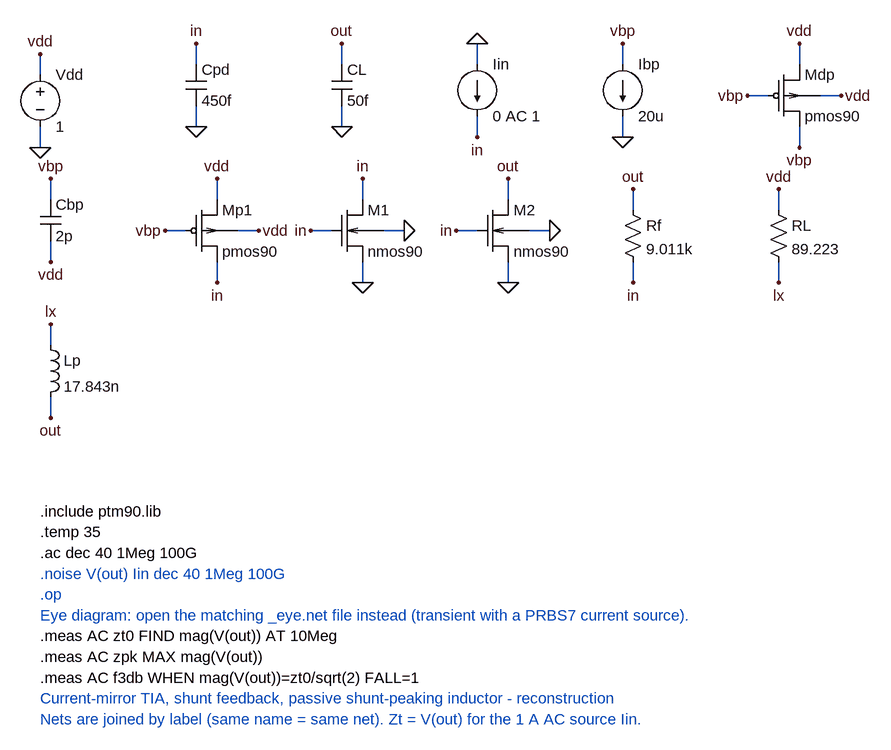
[diagram p0: schematic ref_shaaban_L.asc]
ref_shaaban_L.asc, the LTspice schematic file:
Version 4
SHEET 1 1600 1400
WIRE 0 16 0 -16
WIRE 0 96 0 128
WIRE 240 0 240 -32
WIRE 240 64 240 96
WIRE 464 0 464 -32
WIRE 464 64 464 96
WIRE 672 0 672 -32
WIRE 672 80 672 112
WIRE 896 0 896 -32
WIRE 896 80 896 112
WIRE 1168 96 1168 128
WIRE 1120 48 1088 48
WIRE 1168 0 1168 -32
WIRE 1200 48 1232 48
WIRE 16 208 16 176
WIRE 16 272 16 304
WIRE 272 304 272 336
WIRE 224 256 192 256
WIRE 272 208 272 176
WIRE 304 256 336 256
WIRE 496 208 496 176
WIRE 448 256 416 256
WIRE 496 304 496 336
WIRE 528 256 560 256
WIRE 720 208 720 176
WIRE 672 256 640 256
WIRE 720 304 720 336
WIRE 752 256 784 256
WIRE 912 224 912 192
WIRE 912 304 912 336
WIRE 1136 224 1136 192
WIRE 1136 304 1136 336
WIRE 16 432 16 400
WIRE 16 512 16 544
FLAG 0 -16 vdd
FLAG 0 128 0
FLAG 240 -32 in
FLAG 240 96 0
FLAG 464 -32 out
FLAG 464 96 0
FLAG 672 -32 0
FLAG 672 112 in
FLAG 896 -32 vbp
FLAG 896 112 0
FLAG 1168 128 vbp
FLAG 1088 48 vbp
FLAG 1168 -32 vdd
FLAG 1232 48 vdd
FLAG 16 176 vbp
FLAG 16 304 vdd
FLAG 272 336 in
FLAG 192 256 vbp
FLAG 272 176 vdd
FLAG 336 256 vdd
FLAG 496 176 in
FLAG 416 256 in
FLAG 496 336 0
FLAG 560 256 0
FLAG 720 176 out
FLAG 640 256 in
FLAG 720 336 0
FLAG 784 256 0
FLAG 912 192 out
FLAG 912 336 in
FLAG 1136 192 vdd
FLAG 1136 336 lx
FLAG 16 400 lx
FLAG 16 544 out
SYMBOL voltage 0 0 R0
SYMATTR InstName Vdd
SYMATTR Value 1
SYMBOL cap 224 0 R0
SYMATTR InstName Cpd
SYMATTR Value 450f
SYMBOL cap 448 0 R0
SYMATTR InstName CL
SYMATTR Value 50f
SYMBOL current 672 0 R0
SYMATTR InstName Iin
SYMATTR Value 0 AC 1
SYMBOL current 896 0 R0
SYMATTR InstName Ibp
SYMATTR Value 20u
SYMBOL tia_pmos4 1120 0 R0
SYMATTR InstName Mdp
SYMATTR Value pmos90
SYMATTR Value2 l=200n w=2u ad=0.4p as=0.4p pd=4.4u ps=4.4u
SYMBOL cap 0 208 R0
SYMATTR InstName Cbp
SYMATTR Value 2p
SYMBOL tia_pmos4 224 208 R0
SYMATTR InstName Mp1
SYMATTR Value pmos90
SYMATTR Value2 l=200n w=4.169u ad=0.8339p as=0.8339p pd=8.739u ps=8.739u
SYMBOL tia_nmos4 448 208 R0
SYMATTR InstName M1
SYMATTR Value nmos90
SYMATTR Value2 l=100n w=2.395u ad=0.479p as=0.479p pd=5.19u ps=5.19u
SYMBOL tia_nmos4 672 208 R0
SYMATTR InstName M2
SYMATTR Value nmos90
SYMATTR Value2 l=100n w=24.53u ad=4.907p as=4.907p pd=49.47u ps=49.47u
SYMBOL res 896 208 R0
SYMATTR InstName Rf
SYMATTR Value 9.011k
SYMBOL res 1120 208 R0
SYMATTR InstName RL
SYMATTR Value 89.223
SYMBOL ind 0 416 R0
SYMATTR InstName Lp
SYMATTR Value 17.843n
TEXT 0 688 Left 2 !.include ptm90.lib
TEXT 0 720 Left 2 !.temp 35
TEXT 0 752 Left 2 !.ac dec 40 1Meg 100G
TEXT 0 784 Left 2 ;.noise V(out) Iin dec 40 1Meg 100G
TEXT 0 816 Left 2 ;.op
TEXT 0 848 Left 2 ;Eye diagram: open the matching _eye.net file instead (transient with a PRBS7 current source).
TEXT 0 880 Left 2 !.meas AC zt0 FIND mag(V(out)) AT 10Meg
TEXT 0 912 Left 2 !.meas AC zpk MAX mag(V(out))
TEXT 0 944 Left 2 !.meas AC f3db WHEN mag(V(out))=zt0/sqrt(2) FALL=1
TEXT 0 976 Left 2 ;Current-mirror TIA, shunt feedback, passive shunt-peaking inductor - reconstruction
TEXT 0 1008 Left 2 ;Nets are joined by label (same name = same net). Zt = V(out) for the 1 A AC source Iin.

The netlist it stands for:
* ref_shaaban_L.asc
Vdd vdd 0 1
Cpd in 0 450f
CL out 0 50f
Iin 0 in 0 AC 1
Ibp vbp 0 20u
Mdp vbp vbp vdd vdd pmos90 l=200n w=2u ad=0.4p as=0.4p pd=4.4u ps=4.4u
Cbp vbp vdd 2p
Mp1 in vbp vdd vdd pmos90 l=200n w=4.169u ad=0.8339p as=0.8339p pd=8.739u ps=8.739u
M1 in in 0 0 nmos90 l=100n w=2.395u ad=0.479p as=0.479p pd=5.19u ps=5.19u
M2 out in 0 0 nmos90 l=100n w=24.53u ad=4.907p as=4.907p pd=49.47u ps=49.47u
Rf out in 9.011k
RL vdd lx 89.223
Lp lx out 17.843n
.model NMOS NMOS
.model PMOS PMOS
.lib standard.mos
.include ptm90.lib
.temp 35
.ac dec 40 1Meg 100G
* .noise V(out) Iin dec 40 1Meg 100G
* .op
* Eye diagram: open the matching _eye.net file instead (transient with a PRBS7 current source).
.meas AC zt0 FIND mag(V(out)) AT 10Meg
.meas AC zpk MAX mag(V(out))
.meas AC f3db WHEN mag(V(out))=zt0/sqrt(2) FALL=1
* Current-mirror TIA, shunt feedback, passive shunt-peaking inductor - reconstruction
* Nets are joined by label (same name = same net). Zt = V(out) for the 1 A AC source Iin.
.backanno
.end